# Altium schematic sheet RP2350.SchDoc
size A4; SheetNumber: 2; SheetTotal: 7
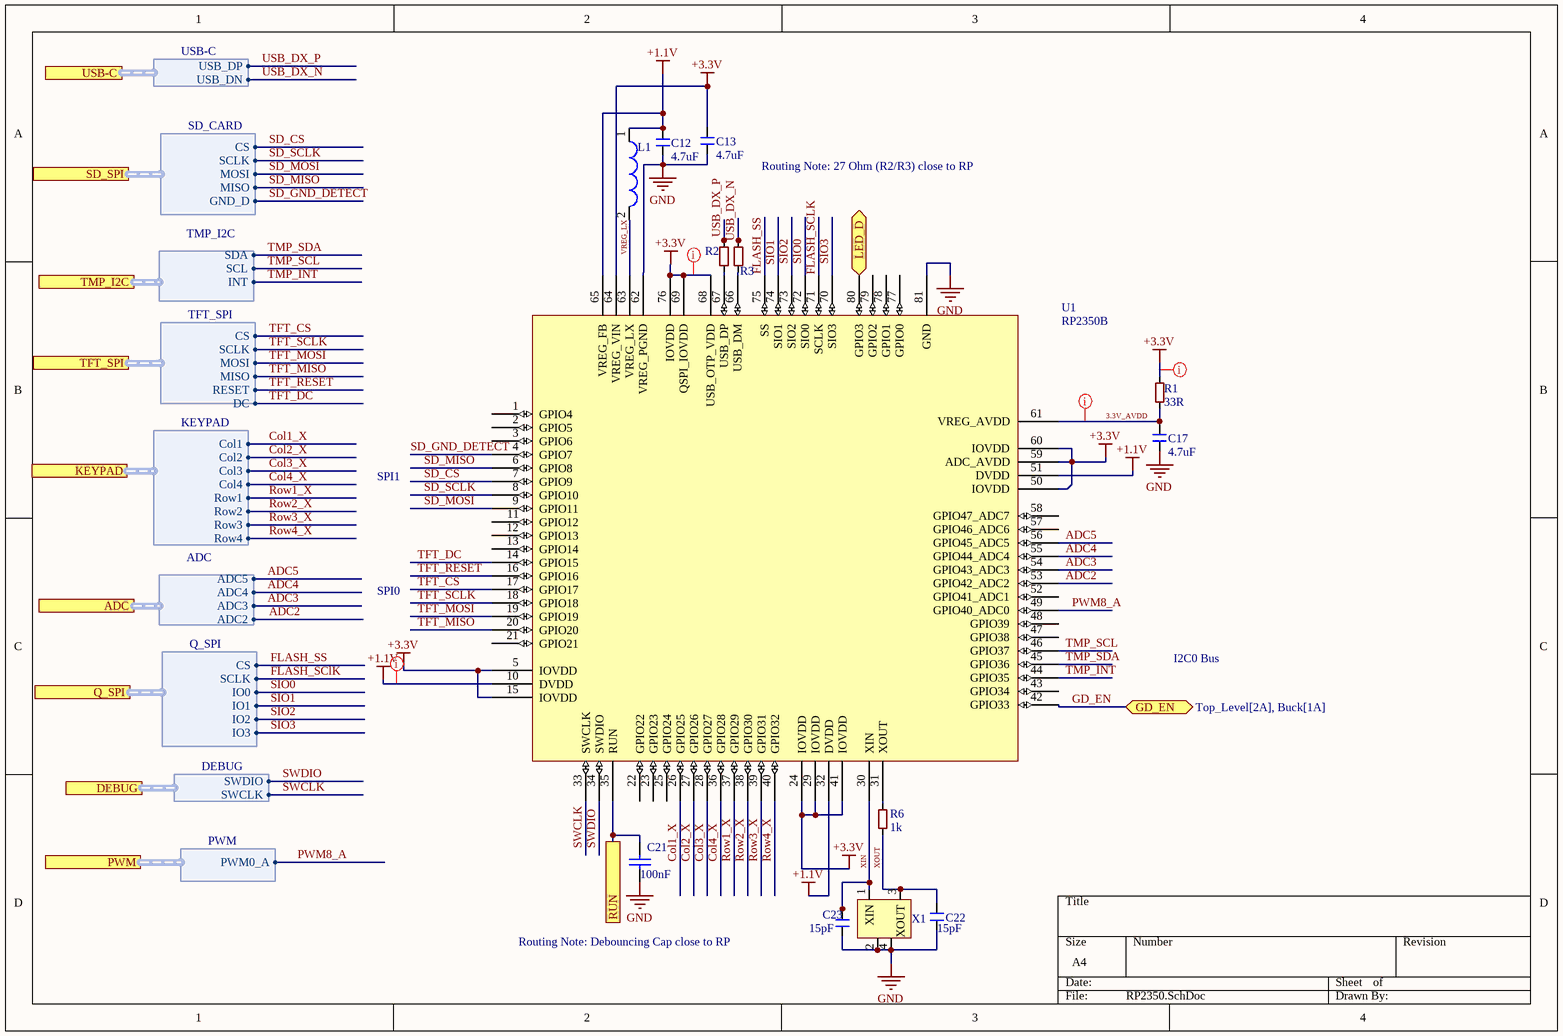
[diagram p0: RP2350.SchDoc]

## Parts
C12  4.7uF  [0402 Resistor]
C13  4.7uF  [0402 Resistor]
C17  4.7uF  [0402 Resistor]
C21  Capacitance: 100nF  [CAPC1050X55X23ML05T13]  (hidden comment: CL05B104KO5NNNC)
C22  C: 15pF  [0402 Resistor]  (hidden comment: CL05C150JB5NNNC)
C23  C: 15pF  [0402 Resistor]  (hidden comment: CL05C150JB5NNNC)
L1  AOTA-B201610S3R3-101-T  [AOTA-B201610S3R3-101-T]  (value not drawn)
R1  33R  [0402 Resistor]
R2  FRC0402F27R0TS  [0402 Resistor]  (value not drawn)
R3  FRC0402F27R0TS  [0402 Resistor]  (value not drawn)
R6  R: 1k  [0402 Resistor]  (hidden comment: FRC0402F1001TS)
U1  RP2350B  [QFN-80]
X1  12MHz  [ABRACON ABM8-272-T3]  (value not drawn)

## Ports
ADC (harness ADC, see Top_Level[2A], Buck[3D]), DEBUG (harness DEBUG, see Top_Level[2B], Connectors[4C]), GD_EN (bidir, see Top_Level[2A], Buck[1A]), KEYPAD (harness KEYPAD, see Top_Level[2C], UI[3A]), LED_D (bidir, see Top_Level[2B], Connectors[2A]), PWM (harness PWM, see Top_Level[2B], Buck[3D]), Q_SPI (harness Q_SPI, see Top_Level[2B], Peripherials[3A]), RUN (see Top_Level[2B], Connectors[4A]), SD_SPI (harness SD_CARD, see Top_Level[2B], Peripherials[3A]), TFT_SPI (harness TFT_SPI, see Top_Level[2C], Peripherials[2A]), TMP_I2C (harness TMP_I2C, see Top_Level[2B], Peripherials[2A]), USB-C (harness USB-C, see Top_Level[2B], Connectors[4C])

## Harnesses
Q_SPI: CS, SCLK, IO0, IO1, IO2, IO3
DEBUG: SWDIO, SWCLK
USB-C: USB_DP, USB_DN
TMP_I2C: SDA, SCL, INT
SD_CARD: CS, SCLK, MOSI, MISO, GND_D
TFT_SPI: CS, SCLK, MOSI, MISO, RESET, DC
ADC: ADC5, ADC4, ADC3, ADC2
KEYPAD: Col1, Col2, Col4, Row1, Row2, Row3, Row4, Col3
PWM: PWM0_A

## Nets
+1.1V: C12.2 L1.1 U1.10(DVDD) U1.32(DVDD) U1.51(DVDD) U1.65(VREG_FB)
+3.3V: C13.2 R1.2 U1.5(IOVDD) U1.15(IOVDD) U1.24(IOVDD) U1.29(IOVDD) U1.41(IOVDD) U1.50(IOVDD) U1.59(ADC_AVDD) U1.60(IOVDD) U1.64(VREG_VIN) U1.68(USB_OTP_VDD) U1.69(QSPI_IOVDD) U1.76(IOVDD)
GND: C12.1 C13.1 C17.1 C21.1 C22.1 C23.1 U1.62(VREG_PGND) U1.81(GND) X1.2(GND) X1.4(GND)
3.3V_AVDD: C17.2 R1.1 U1.61(VREG_AVDD)
ADC2: U1.53(GPIO42_ADC2) ; port ADC.ADC2
ADC3: U1.54(GPIO43_ADC3) ; port ADC.ADC3
ADC4: U1.55(GPIO44_ADC4) ; port ADC.ADC4
ADC5: U1.56(GPIO45_ADC5) ; port ADC.ADC5
Col1_X: U1.26(GPIO25) ; port KEYPAD.Col1
Col2_X: U1.27(GPIO26) ; port KEYPAD.Col2
Col3_X: U1.28(GPIO27) ; port KEYPAD.Col3
Col4_X: U1.36(GPIO28) ; port KEYPAD.Col4
FLASH_SCLK: U1.71(SCLK) ; port Q_SPI.SCLK
FLASH_SS: U1.75(SS) ; port Q_SPI.CS
GD_EN: U1.42(GPIO33) ; port GD_EN
LED_D: U1.80(GPIO3) ; port LED_D
PWM8_A: U1.49(GPIO40_ADC0) ; port PWM.PWM0_A
Row1_X: U1.37(GPIO29) ; port KEYPAD.Row1
Row2_X: U1.38(GPIO30) ; port KEYPAD.Row2
Row3_X: U1.39(GPIO31) ; port KEYPAD.Row3
Row4_X: U1.40(GPIO32) ; port KEYPAD.Row4
RUN: C21.2 U1.35(RUN) ; port RUN
SD_CS: U1.7(GPIO9) ; port SD_SPI.CS
SD_GND_DETECT: U1.4(GPIO7) ; port SD_SPI.GND_D
SD_MISO: U1.6(GPIO8) ; port SD_SPI.MISO
SD_MOSI: U1.9(GPIO11) ; port SD_SPI.MOSI
SD_SCLK: U1.8(GPIO10) ; port SD_SPI.SCLK
SIO0: U1.72(SIO0) ; port Q_SPI.IO0
SIO1: U1.74(SIO1) ; port Q_SPI.IO1
SIO2: U1.73(SIO2) ; port Q_SPI.IO2
SIO3: U1.70(SIO3) ; port Q_SPI.IO3
SWCLK: U1.33(SWCLK) ; port DEBUG.SWCLK
SWDIO: U1.34(SWDIO) ; port DEBUG.SWDIO
TFT_CS: U1.17(GPIO17) ; port TFT_SPI.CS
TFT_DC: U1.14(GPIO15) ; port TFT_SPI.DC
TFT_MISO: U1.20(GPIO20) ; port TFT_SPI.MISO
TFT_MOSI: U1.19(GPIO19) ; port TFT_SPI.MOSI
TFT_RESET: U1.16(GPIO16) ; port TFT_SPI.RESET
TFT_SCLK: U1.18(GPIO18) ; port TFT_SPI.SCLK
TMP_INT: U1.44(GPIO35) ; port TMP_I2C.INT
TMP_SCL: U1.46(GPIO37) ; port TMP_I2C.SCL
TMP_SDA: U1.45(GPIO36) ; port TMP_I2C.SDA
USB_DX_N: R3.2 ; port USB-C.USB_DN
USB_DX_P: R2.2 ; port USB-C.USB_DP
VREG_LX: L1.2 U1.63(VREG_LX)
XIN: C23.2 U1.30(XIN) X1.1(XIN)
XOUT: C22.2 R6.1 X1.3(XOUT)
NetR2_1: R2.1 U1.67(USB_DP)
NetR3_1: R3.1 U1.66(USB_DM)
NetR6_2: R6.2 U1.31(XOUT)

Not connected (* = marked no-connect by the designer): U1 1(GPIO4) 2(GPIO5) 3(GPIO6) 11(GPIO12) 12(GPIO13) 13(GPIO14) 21(GPIO21) 22(GPIO22) 23(GPIO23) 25(GPIO24) 43(GPIO34) 47(GPIO38) 48(GPIO39) 52(GPIO41_ADC1) 57(GPIO46_ADC6) 58(GPIO47_ADC7) 77(GPIO0) 78(GPIO1) 79(GPIO2)

## Layout directives
net class Power: 3.3V_AVDD, +1.1V, +3.3V

## Notes on the sheet
- Routing Note: 27 Ohm (R2/R3) close to RP
- SPI1
- SPI0
- I2C0 Bus
- Routing Note: Debouncing Cap close to RP

## Library data of the parts
C12 C13 C17 = CL05A475MP5NRNC: CAP CER 4.7uF 10V X5R 0402; C: 4.7uF; LCSC Part #: C23733; Datasheet: https://www.lcsc.com/datasheet/C23733.pdf
C21 = CMP-2000-05439-1: Chip Capacitor, 100 nF, +/- 10%, 16 V, -55 to 125 degC, 0402 (1005 Metric), RoHS, Tape and Reel; Manufacturer: Samsung Electro-Mechanics; Dielectric: X7R; Rated Voltage: 16V; Case Size/Dimension: 0402; Tolerance (%): ±10%; Manufacturer URL: http://www.samsungsem.com/global/index.jsp; Datasheet URL: https://datasheet.ciiva.com/29198/458718-da-01-en-vs-kondensator-0402-29198423.pdf; Datasheet Version: Nov-10; LCSC Part #: C1525; Datasheet: https://www.lcsc.com/datasheet/C1525.pdf
C22 C23 = CL05C150JB5NNNC: CAP CER 15pF 50V C0G 0402; LCSC Part #: C86285
L1 = AOTA-B201610S3R3-101-T: 3.3uH, 0806; Inductance: 3.3uH; LCSC Part #: C42411119
R1 = FRC0402F33R0TS: RES 33Ω ±1% 62.5mW 0402; R: 33; Datasheet: https://www.lcsc.com/datasheet/C2906868.pdf; LCSC Part #: C2906868
R2 R3 = FRC0402F27R0TS: R: 27; LCSC Part #: C2909343
R6 = FRC0402F1001TS: RES 1kΩ ±1% 62.5mW 0402; LCSC Part #: C2906864
U1 = CMP-054-000000-1: RP2350B QFPN 80 pins; Design Item ID: RP2350B; LCSC Part Number: C42415655; Source: ECE362.SchLib; Manufacturer Part Number: RP2350B
X1 = ABM8-272-T3: Ultra Miniature Ceramic SMD Crystal, 12MHz, 50 Ohm ESR, +/- 30ppm tolerance, 10pF load capacitance, Recommended for RP2350B; ESR: 50R; Frequency: 12MHz; Tolerance: +/- 30ppm; Load Capacitance: 10pF; LCSC Part #: C20625731